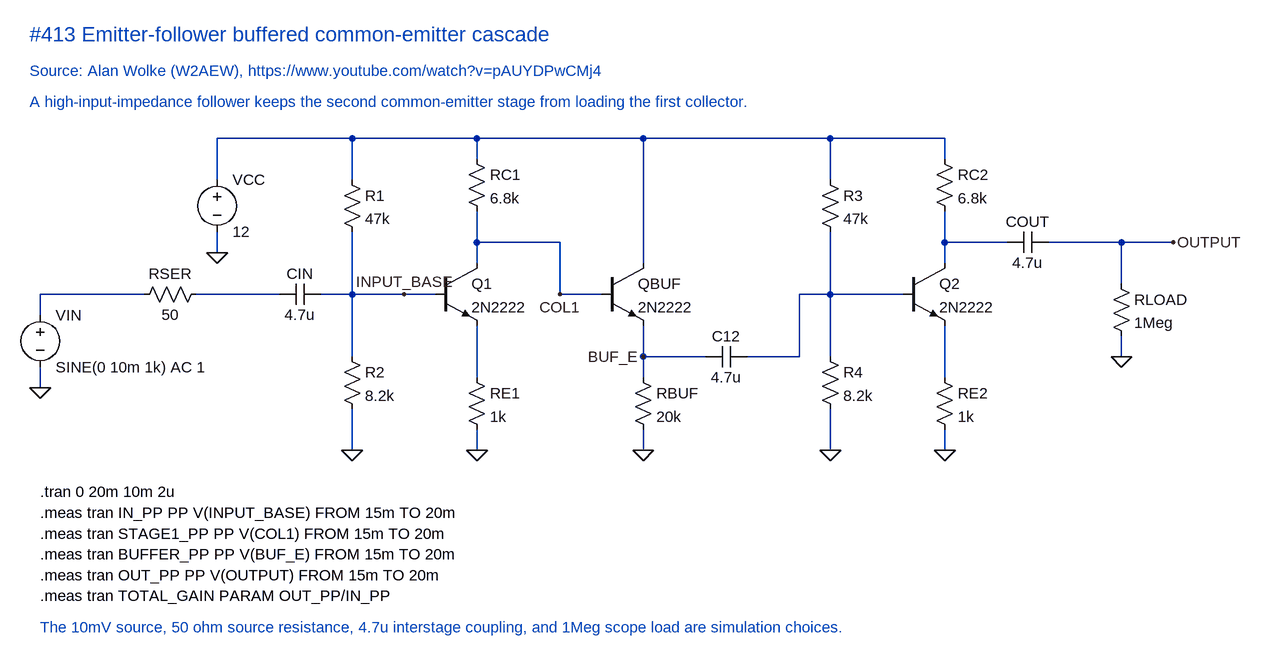
[diagram p0: schematic Emitter-follower buffered cascade.asc]
Emitter-follower buffered cascade.asc, the LTspice schematic file:
Version 4.1
SHEET 1 1800 900
WIRE 160 -128 -48 -128
WIRE 352 -128 160 -128
WIRE 608 -128 352 -128
WIRE 896 -128 608 -128
WIRE 1072 -128 896 -128
WIRE 608 32 608 -128
WIRE 896 -64 896 -128
WIRE 1072 -96 1072 -128
WIRE -48 -64 -48 -128
WIRE 160 -64 160 -128
WIRE 352 -96 352 -128
WIRE 352 32 352 -16
WIRE 480 32 352 32
WIRE 480 112 480 32
WIRE 544 112 480 112
WIRE -48 48 -48 16
WIRE 352 64 352 32
WIRE -320 112 -320 144
WIRE -160 112 -320 112
WIRE 48 112 -80 112
WIRE 160 112 112 112
WIRE 160 112 160 16
WIRE 240 112 160 112
WIRE 288 112 240 112
WIRE 160 208 160 112
WIRE 352 240 352 160
WIRE -320 256 -320 224
WIRE 160 352 160 288
WIRE 352 352 352 320
WIRE 608 64 608 32
WIRE 608 208 608 160
WIRE 608 240 608 208
WIRE 608 352 608 320
WIRE 704 208 608 208
WIRE 848 208 768 208
WIRE 848 112 848 208
WIRE 896 112 848 112
WIRE 896 112 896 16
WIRE 896 208 896 112
WIRE 1008 112 896 112
WIRE 896 352 896 288
WIRE 1072 32 1072 -16
WIRE 1072 64 1072 32
WIRE 1072 240 1072 160
WIRE 1072 352 1072 320
WIRE 1168 32 1072 32
WIRE 1344 32 1232 32
WIRE 1424 32 1344 32
WIRE 1344 96 1344 32
WIRE 1344 208 1344 176
FLAG -48 48 0
FLAG -320 256 0
FLAG 160 352 0
FLAG 352 352 0
FLAG 608 352 0
FLAG 896 352 0
FLAG 1072 352 0
FLAG 1344 208 0
FLAG 240 112 INPUT_BASE
FLAG 480 112 COL1
FLAG 608 208 BUF_E
FLAG 1424 32 OUTPUT
SYMBOL voltage -48 -80 R0
SYMATTR InstName VCC
SYMATTR Value 12
SYMBOL voltage -320 128 R0
SYMATTR InstName VIN
SYMATTR Value SINE(0 10m 1k) AC 1
SYMBOL res -64 96 R90
WINDOW 0 0 56 VBottom 2
WINDOW 3 32 56 VTop 2
SYMATTR InstName RSER
SYMATTR Value 50
SYMBOL cap 112 96 R90
WINDOW 0 0 32 VBottom 2
WINDOW 3 32 32 VTop 2
SYMATTR InstName CIN
SYMATTR Value 4.7u
SYMBOL res 144 -80 R0
SYMATTR InstName R1
SYMATTR Value 47k
SYMBOL res 144 192 R0
SYMATTR InstName R2
SYMATTR Value 8.2k
SYMBOL res 336 -112 R0
SYMATTR InstName RC1
SYMATTR Value 6.8k
SYMBOL npn 288 64 R0
SYMATTR InstName Q1
SYMATTR Value 2N2222
SYMBOL res 336 224 R0
SYMATTR InstName RE1
SYMATTR Value 1k
SYMBOL npn 544 64 R0
SYMATTR InstName QBUF
SYMATTR Value 2N2222
SYMBOL res 592 224 R0
SYMATTR InstName RBUF
SYMATTR Value 20k
SYMBOL cap 768 192 R90
WINDOW 0 0 32 VBottom 2
WINDOW 3 32 32 VTop 2
SYMATTR InstName C12
SYMATTR Value 4.7u
SYMBOL res 880 -80 R0
SYMATTR InstName R3
SYMATTR Value 47k
SYMBOL res 880 192 R0
SYMATTR InstName R4
SYMATTR Value 8.2k
SYMBOL res 1056 -112 R0
SYMATTR InstName RC2
SYMATTR Value 6.8k
SYMBOL npn 1008 64 R0
SYMATTR InstName Q2
SYMATTR Value 2N2222
SYMBOL res 1056 224 R0
SYMATTR InstName RE2
SYMATTR Value 1k
SYMBOL cap 1232 16 R90
WINDOW 0 0 32 VBottom 2
WINDOW 3 32 32 VTop 2
SYMATTR InstName COUT
SYMATTR Value 4.7u
SYMBOL res 1328 80 R0
SYMATTR InstName RLOAD
SYMATTR Value 1Meg
TEXT -336 -288 Left 3 ;#413 Emitter-follower buffered common-emitter cascade
TEXT -336 -232 Left 2 ;Source: Alan Wolke (W2AEW), https://www.youtube.com/watch?v=pAUYDPwCMj4
TEXT -336 -184 Left 2 ;A high-input-impedance follower keeps the second common-emitter stage from loading the first collector.
TEXT -320 416 Left 2 !.tran 0 20m 10m 2u
TEXT -320 448 Left 2 !.meas tran IN_PP PP V(INPUT_BASE) FROM 15m TO 20m
TEXT -320 480 Left 2 !.meas tran STAGE1_PP PP V(COL1) FROM 15m TO 20m
TEXT -320 512 Left 2 !.meas tran BUFFER_PP PP V(BUF_E) FROM 15m TO 20m
TEXT -320 544 Left 2 !.meas tran OUT_PP PP V(OUTPUT) FROM 15m TO 20m
TEXT -320 576 Left 2 !.meas tran TOTAL_GAIN PARAM OUT_PP/IN_PP
TEXT -320 624 Left 2 ;The 10mV source, 50 ohm source resistance, 4.7u interstage coupling, and 1Meg scope load are simulation choices.

The netlist it stands for:
* Emitter-follower buffered cascade.asc
VCC N001 0 12
VIN N002 0 SINE(0 10m 1k) AC 1
RSER N003 N002 50
CIN INPUT_BASE N003 4.7u
R1 N001 INPUT_BASE 47k
R2 INPUT_BASE 0 8.2k
RC1 N001 COL1 6.8k
Q1 COL1 INPUT_BASE N004 0 2N2222
RE1 N004 0 1k
QBUF N001 COL1 BUF_E 0 2N2222
RBUF BUF_E 0 20k
C12 N005 BUF_E 4.7u
R3 N001 N005 47k
R4 N005 0 8.2k
RC2 N001 N006 6.8k
Q2 N006 N005 N007 0 2N2222
RE2 N007 0 1k
COUT OUTPUT N006 4.7u
RLOAD OUTPUT 0 1Meg
.model NPN NPN
.model PNP PNP
.lib standard.bjt
* #413 Emitter-follower buffered common-emitter cascade
* Source: Alan Wolke (W2AEW), https://www.youtube.com/watch?v=pAUYDPwCMj4
* A high-input-impedance follower keeps the second common-emitter stage from loading the first collector.
.tran 0 20m 10m 2u
.meas tran IN_PP PP V(INPUT_BASE) FROM 15m TO 20m
.meas tran STAGE1_PP PP V(COL1) FROM 15m TO 20m
.meas tran BUFFER_PP PP V(BUF_E) FROM 15m TO 20m
.meas tran OUT_PP PP V(OUTPUT) FROM 15m TO 20m
.meas tran TOTAL_GAIN PARAM OUT_PP/IN_PP
* The 10mV source, 50 ohm source resistance, 4.7u interstage coupling, and 1Meg scope load are simulation choices.
.backanno
.end